# EasyEDA Pro project elisaday-high-color-value-low-cost-reflow-24a201e4.epro, schematic 控制板-无0402
Board Name: 220V控制板-无0402; Create Date: 2025-07-29; Page Name: 控制板; Project Name: 高颜值低成本回流焊红龙加热台; Schematic Name: 控制板-无0402; Update Date: 2025-08-03; Company: 嘉立创EDA; Page Size: A4; Version: V1.0
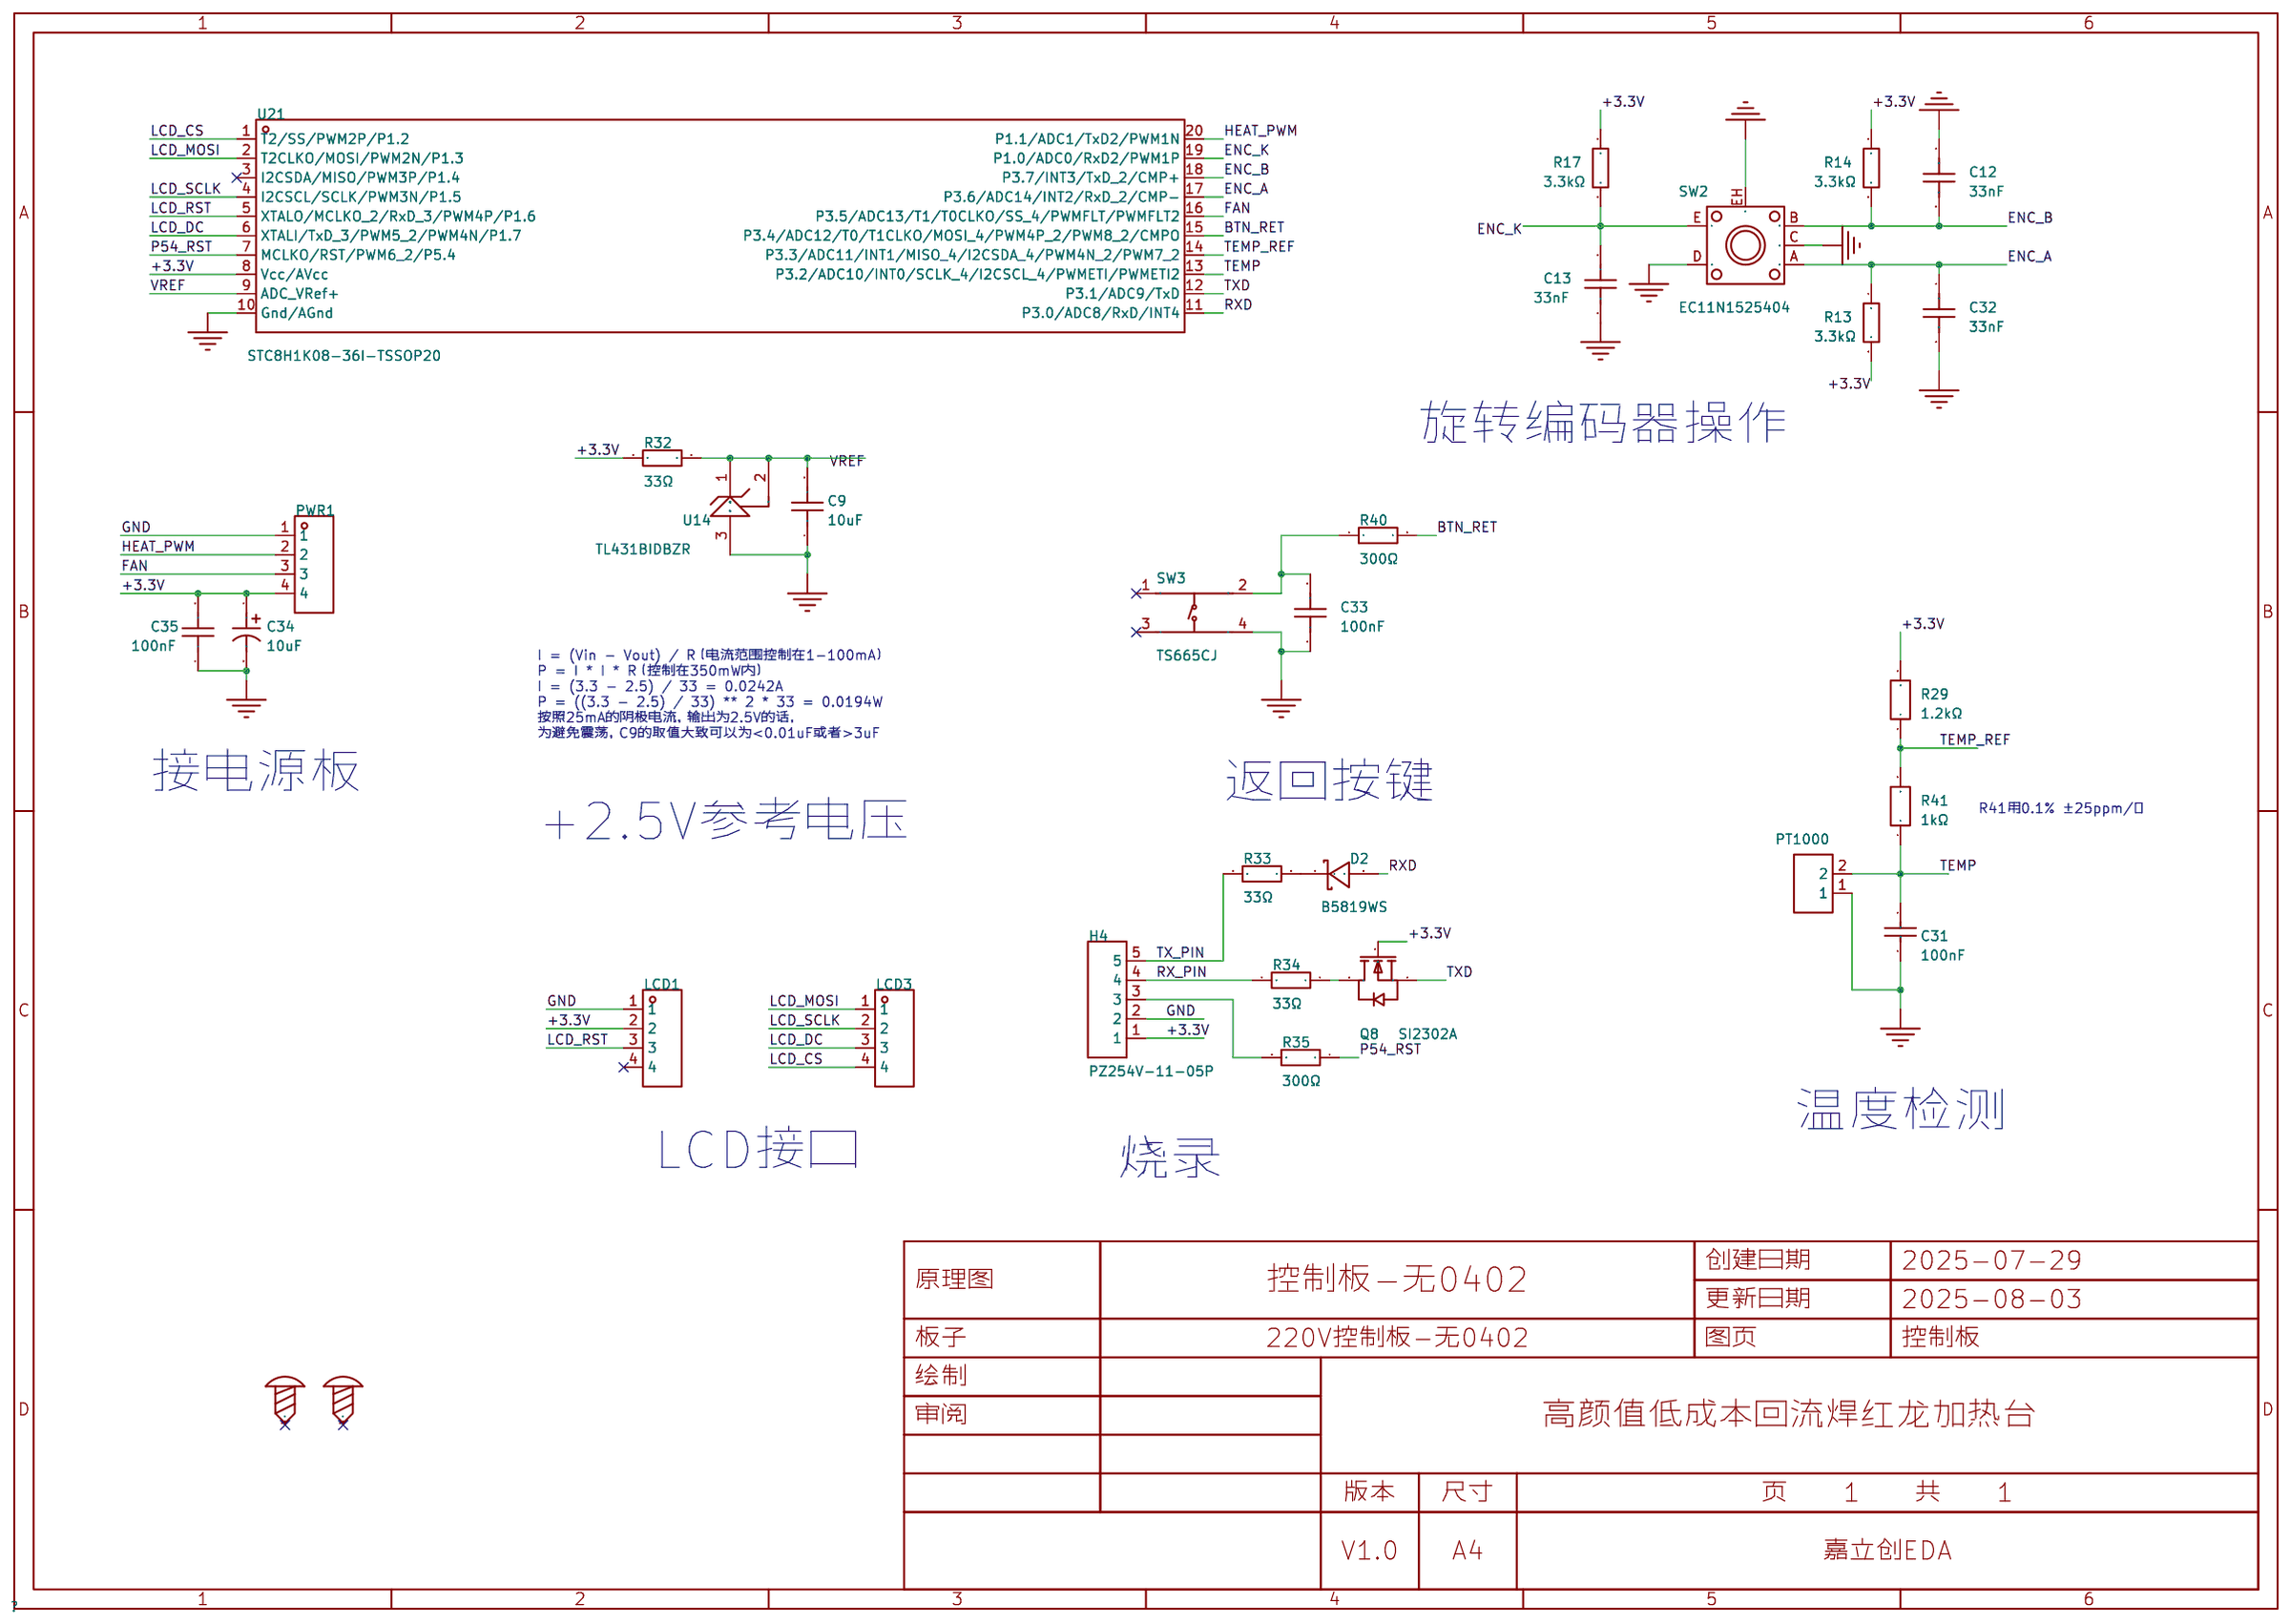
[diagram p1: schematic sheet]

## Parts
C9  10uF  [C0805]
C12  33nF  [C0603]
C13  33nF  [C0603]
C31  100nF  [C0805]
C32  33nF  [C0603]
C33  100nF  [C0805]
C34  10uF  [CAP-TH_BD5.0-P2.00-D0.8-FD]
C35  100nF  [C0805]
D2  B5819WS  [SOD-323_L1.8-W1.3-LS2.5-RD]
H4  PZ254V-11-05P  [HDR-TH_5P-P2.54-V-M]
LCD1  PZ254V-11-04P  [HDR-TH_4P-P2.54-V-M]
LCD3  PZ254V-11-04P  [HDR-TH_4P-P2.54-V-M]
PT1000  ZX-XH2.54-2PZZ  [CONN-TH_2P-P2.50_HX25003-2A]
PWR1  ZX-XH2.54-4PZZ  [CONN-TH_4P-P2.50_4PIN]
Q8  SI2302A  [SOT-23-3_L2.9-W1.3-P1.90-LS2.4-BR]
R13  3.3kΩ  [R0603]
R14  3.3kΩ  [R0603]
R17  3.3kΩ  [R0603]
R29  1.2kΩ  [R0805]
R32  33Ω  [R0805]
R33  33Ω  [R0805]
R34  33Ω  [R0805]
R35  300Ω  [R0805]
R40  300Ω  [R0805]
R41  1kΩ  [R0603]
SCREW1  -  [M3螺丝]
SCREW2  -  [M3螺丝]
SW2  EC11N1525404  [SW-TH_EC11NXXXX]
SW3  TS665CJ  [SW-TH_4P-L6.0-W6.0-P4.50-LS6.5]
U14  TL431BIDBZR  [SOT-23-3_L2.9-W1.3-P1.90-LS2.4-BR]
U21  STC8H1K08-36I-TSSOP20  [TSSOP-20_L6.5-W4.4-P0.65-LS6.4-BL]

## Library data of the parts
C9 = CL21A106KOQNNNE: 容值:10uF;精度:±10%;额定电压:16V;材质(温度系数):X5R;; LCSC Part Name: 10uF ±10% 16V; Supplier Part: C1713; Manufacturer: SAMSUNG(三星); Supplier Footprint: 0805; JLCPCB Part Class: Extended Part; Datasheet: https://atta.szlcsc.com/upload/public/pdf/source/20160218/1457707763339.pdf; Supplier: LCSC; Tolerance: ±10%; Voltage Rated: 16V; Temperature Coefficient: X5R
C12 C13 C32 = CC0603KRX7R9BB333: 容值:33nF;精度:±10%;额定电压:50V;材质(温度系数):X7R;; LCSC Part Name: 33nF ±10% 50V; Supplier Part: C106856; Manufacturer: YAGEO(国巨); Supplier Footprint: 0603; JLCPCB Part Class: Extended Part; Datasheet: https://atta.szlcsc.com/upload/public/pdf/source/20170919/C131031_1505787245477976978.pdf; Supplier: LCSC; Tolerance: ±10%; Voltage Rated: 50V; Temperature Coefficient: X7R
C31 C33 C35 = 0805B104K500NT: 容值:100nF;精度:±10%;额定电压:50V;温度系数:X7R;; LCSC Part Name: 100nF ±10% 50V; Supplier Part: C38141; Manufacturer: FH(风华); Supplier Footprint: 0805; JLCPCB Part Class: Extended Part; Datasheet: https://atta.szlcsc.com/upload/public/pdf/source/20200305/C486355_26A10D38EF8C2A5C37091D0039909270.pdf; Supplier: LCSC; Tolerance: ±10%; Voltage Rating: 50V; Temperature Coefficient: X7R
C34 = ERS1HM100D11OT: 容值:10uF;精度:±20%;额定电压:50V;; LCSC Part Name: 10uF ±20% 50V; Supplier Part: C106654; Manufacturer: AISHI(艾华集团); Supplier Footprint: 插件,D5xL11mm; JLCPCB Part Class: Extended Part; Datasheet: https://atta.szlcsc.com/upload/public/pdf/source/20191015/C438940_4B8E60A742BB0AE40DDEF87A5C89089D.pdf; Supplier: LCSC; Tolerance: ±20%; Voltage Rating: 50V; Pin Spacing: 2mm; Diameter: 5mm; Height - Seated (Max): 11mm; Lifetime: 5000hrs@105℃
D2 = B5819WS_C22624: 正向压降(Vf):600mV@1A;直流反向耐压(Vr):40V;平均整流电流(Io):1A;; LCSC Part Name: 电压:40V 电流:1A; Supplier Part: C22624; Manufacturer: CJ(江苏长电/长晶); Supplier Footprint: SOD-323; JLCPCB Part Class: 扩展库; Datasheet: https://atta.szlcsc.com/upload/public/pdf/source/20150407/1457707273359.pdf; Supplier: LCSC; Forward Voltage (Vf@If): 600mV@1A; Reverse Voltage (Vr): 40V; Average Rectified Current (Io): 1A
H4 = PZ254V-11-05P: 插针结构:1x5P;间距:2.54mm;行距:-;圆针/方针:方针;安装方式:直插;排数:单排;总PIN位数:5P;额定电流:-;额定电压:-;配合针长度:6mm;塑高:2.5mm;端接针长度:3mm;触头材质:黄铜;触头镀层:-;工作温度:-40℃~+105℃;颜色:黑色;; LCSC Part Name: 1x5P 间距:2.54mm 方针 直插; Supplier Part: C492404; Manufacturer: XFCN(兴飞); Supplier Footprint: 插件,P=2.54mm; JLCPCB Part Class: 扩展库; Datasheet: https://atta.szlcsc.com/upload/public/pdf/source/20200309/C492404_E51533260F8710EFF5D4617281164C1D.pdf; Supplier: LCSC; Pin Structure: 1x5P; Pitch: 2.54mm; Circluar Pins/Square Pins: 方针; Mounting Type: 直插; Number of Rows: 单排; Number of Pins: 5P; Length of Mating Pin: 6mm; Insulation Height: 2.5mm; Length of End Connection Pin: 3mm; Contact Material: 黄铜; Operating Temperature: -40℃~+105℃; Color: 黑色
LCD1 LCD3 = PZ254V-11-04P: 插针结构:1x4P;间距:2.54mm;行距:-;圆针/方针:方针;安装类型:直插;排数:单排;总PIN位数:4P;额定电流:3A;额定电压:250V;配合针长度:6mm;塑高:2.5mm;端接针长度:3mm;触头材质:-;工作温度范围:-40℃~+105℃;颜色:黑色;; LCSC Part Name: 间距:2.54mm 1x4P 直插 方针; Supplier Part: C2691448; Manufacturer: XFCN(兴飞); Supplier Footprint: 插件,P=2.54mm; JLCPCB Part Class: 扩展库; Datasheet: https://atta.szlcsc.com/upload/public/pdf/source/20200309/C492403_F9F19131791D08044AD4F84F8E751A34.pdf; Supplier: LCSC; Pin Structure: 1x4P; Pitch: 2.54mm; Circluar Pins/Square Pins: 方针; Mounting Type: 直插; Number of Rows: 单排; Number of Pins: 4P; Current Rating (Max): 3A; Voltage Rating (Max): 250V; Length of Mating Pin: 6mm; Insulation Height: 2.5mm; Length of End Connection Pin: 3mm; Operating Temperature Range: -40℃~+105℃; Color: 黑色
PT1000 = ZX-XH2.54-2PZZ: 插针结构:1x2P;间距:2.5mm;安装方式:直插;参考系列:XH;总PIN数:2P;排数:1;每排PIN数:2;行距:-;额定电流:3A;触头材质:黄铜;触头镀层:锡;工作温度范围:-25℃~+85℃;; LCSC Part Name: 1x2P 间距:2.5mm 直插 系列:XH; Supplier Part: C7429632; Manufacturer: Megastar(兆星); Supplier Footprint: 插件,P=2.5mm; JLCPCB Part Class: 扩展库; Datasheet: https://atta.szlcsc.com/upload/public/pdf/source/20230619/19BA6947230AA44A04D3EDD65E618FD0.pdf; Supplier: LCSC; Pins Structure: 1x2P; Pitch: 2.5mm; Mounting Type: 直插; Reference Series: XH; Number of Pins: 2P; Number of Rows: 1; Number of PINs Per Row: 2; Rated Current: 3A; Contact Material: 黄铜; Contact Plating: 锡; Operating Temperature: -25℃~+85℃; Rated Voltage (Max): 250V; Plastic Material: PA66; Flame Retardant Rating: UL94V-0; Color: 白色; Z-Height of the Board: 7mm; X-Length of Bottom Edge on Board (Spacing Line): 7.5mm; Y-Width of Bottom Edge on Board: 5.9mm
PWR1 = ZX-XH2.54-4PZZ: 插针结构:1x4P;间距:2.5mm;安装方式:直插;参考系列:XH;总PIN数:4P;排数:1;每排PIN数:4;行距:-;额定电流:3A;触头材质:黄铜;触头镀层:锡;工作温度范围:-25℃~+85℃;; LCSC Part Name: 1x4P 间距:2.5mm 直插 系列:XH; Supplier Part: C7429634; Manufacturer: Megastar(兆星); Supplier Footprint: 插件,P=2.5mm; JLCPCB Part Class: 扩展库; Datasheet: https://atta.szlcsc.com/upload/public/pdf/source/20230619/B529A2163E0159A644AB3383D208FB03.pdf; Supplier: LCSC; Pins Structure: 1x4P; Pitch: 2.5mm; Mounting Type: 直插; Reference Series: XH; Number of Pins: 4P; Number of Rows: 1; Number of PINs Per Row: 4; Rated Current: 3A; Contact Material: 黄铜; Contact Plating: 锡; Operating Temperature: -25℃~+85℃; Rated Voltage (Max): 250V; Plastic Material: PA66; Flame Retardant Rating: UL94V-0; Color: 白色; Z-Height of the Board: 7mm; X-Length of Bottom Edge on Board (Spacing Line): 12.5mm; Y-Width of Bottom Edge on Board: 5.9mm
Q8 = SI2302A: 类型:1个N沟道;漏源电压(Vdss):20V;连续漏极电流(Id):3.6A;导通电阻(RDS(on)@Vgs,Id):60mΩ@2.5V,3.1A;功率(Pd):800mW;阈值电压(Vgs(th)@Id):1.9V@250uA;; LCSC Part Name: 1个N沟道 耐压:20V 电流:3.6A; Supplier Part: C347483; Manufacturer: UMW(友台半导体); Supplier Footprint: SOT-23; JLCPCB Part Class: 扩展库; Datasheet: https://atta.szlcsc.com/upload/public/pdf/source/20231109/A05513FBA15B68C9BEB83ADF1A9CDC8E.pdf; Supplier: LCSC; Type: 1个N沟道; Drain Source Voltage (Vdss): 20V; Continuous Drain Current (Id): 3.6A; Drain Source On Resistance (RDS(on)@Vgs,Id): 60mΩ@2.5V,3.1A; Power Dissipation (Pd): 800mW; Gate Threshold Voltage (Vgs(th)@Id): 1.9V@250uA; Total Gate Charge (Qg@Vgs): 10nC@4.5V; Input Capacitance (Ciss@Vds): 300pF@10V; Reverse Transfer Capacitance (Crss@Vds): 80pF@10V; Operating Temperature: -55℃~+150℃
R13 R14 R17 = 0603WAF3301T5E: 电阻类型:厚膜电阻;阻值:3.3kΩ;精度:±1%;功率:100mW;最大工作电压:75V;温度系数:±100ppm/℃;; LCSC Part Name: 3.3kΩ ±1% 100mW 厚膜电阻; Supplier Part: C22978; Manufacturer: UNI-ROYAL(厚声); Supplier Footprint: 0603; JLCPCB Part Class: Basic Part; Datasheet: https://atta.szlcsc.com/upload/public/pdf/source/20200306/C422600_1E6D84923E4A46A82E41ADD87F860B5C.pdf; Supplier: LCSC; Type: 厚膜电阻; Tolerance: ±1%; Power(Watts): 100mW; Overload Voltage (Max): 75V; Temperature Coefficient: ±100ppm/℃; Operating Temperature Range: -55℃~+155℃
R29 = 0805W8F1201T5E: 电阻类型:厚膜电阻;阻值:1.2kΩ;精度:±1%;功率:125mW;最大工作电压:150V;温度系数:±100ppm/℃;; LCSC Part Name: 1.2kΩ ±1% 125mW 厚膜电阻; Supplier Part: C17379; Manufacturer: UNI-ROYAL(厚声); Supplier Footprint: 0805; JLCPCB Part Class: Basic Part; Datasheet: https://atta.szlcsc.com/upload/public/pdf/source/20200306/C422600_1E6D84923E4A46A82E41ADD87F860B5C.pdf; Supplier: LCSC; Type: 厚膜电阻; Tolerance: ±1%; Power(Watts): 125mW; Overload Voltage (Max): 150V; Temperature Coefficient: ±100ppm/℃; Operating Temperature Range: -55℃~+155℃
R32-R34 = 0805W8F330JT5E: 电阻类型:厚膜电阻;阻值:33Ω;精度:±1%;功率:125mW;最大工作电压:150V;温度系数:±200ppm/℃;; LCSC Part Name: 33Ω ±1% 125mW 厚膜电阻; Supplier Part: C17634; Manufacturer: UNI-ROYAL(厚声); Supplier Footprint: 0805; JLCPCB Part Class: Basic Part; Datasheet: https://atta.szlcsc.com/upload/public/pdf/source/20200306/C422600_1E6D84923E4A46A82E41ADD87F860B5C.pdf; Supplier: LCSC; Type: 厚膜电阻; Tolerance: ±1%; Power(Watts): 125mW; Overload Voltage (Max): 150V; Temperature Coefficient: ±200ppm/℃; Operating Temperature Range: -55℃~+155℃
R35 R40 = 0805W8F3000T5E: 电阻类型:厚膜电阻;阻值:300Ω;精度:±1%;功率:125mW;最大工作电压:150V;温度系数:±100ppm/℃;; LCSC Part Name: 300Ω ±1% 125mW 厚膜电阻; Supplier Part: C17617; Manufacturer: UNI-ROYAL(厚声); Supplier Footprint: 0805; JLCPCB Part Class: Basic Part; Datasheet: https://atta.szlcsc.com/upload/public/pdf/source/20200306/C422600_1E6D84923E4A46A82E41ADD87F860B5C.pdf; Supplier: LCSC; Type: 厚膜电阻; Tolerance: ±1%; Power(Watts): 125mW; Overload Voltage (Max): 150V; Temperature Coefficient: ±100ppm/℃; Operating Temperature Range: -55℃~+155℃
R41 = RT0603BRD071KL: 电阻类型:薄膜电阻;阻值:1kΩ;精度:±0.1%;功率:100mW;最大工作电压:75V;温度系数:±25ppm/℃;; LCSC Part Name: 薄膜电阻 1kΩ ±0.1% 100mW; Supplier Part: C110776; Manufacturer: YAGEO(国巨); Supplier Footprint: 0603; JLCPCB Part Class: Extended Part; Datasheet: https://atta.szlcsc.com/upload/public/pdf/source/20170704/1499151282044.pdf; Supplier: LCSC; Type: 薄膜电阻; Tolerance: ±0.1%; Power(Watts): 100mW; Overload Voltage (Max): 75V; Temperature Coefficient: ±25ppm/℃; Operating Temperature Range: -55℃~+155℃
SCREW1 SCREW2 = M3螺丝: Supplier Footprint: 插件; Check: false
SW2 = EC11N1525404: Supplier Part: C470748; Manufacturer: ALPSALPINE(阿尔卑斯阿尔派); Supplier Footprint: 插件; JLCPCB Part Class: 扩展库; Datasheet: https://atta.szlcsc.com/upload/public/pdf/source/20191216/C470795_DE763ECE59BD49533DB26DB53E5D34B2.pdf; Supplier: LCSC
SW3 = TS665CJ: 电路结构:单刀单掷;按钮形状:圆形按钮;安装方式:直插;开关长度:6mm;开关宽度:6mm;开关高度:5mm;触点电流:50mA;额定电压(DC):12V;带灯:-;机械寿命:-;; LCSC Part Name: 6*6*5mm 直插 轻触开关; Supplier Part: C393938; Manufacturer: SHOU HAN(首韩); Supplier Footprint: 插件; JLCPCB Part Class: 扩展库; Datasheet: https://atta.szlcsc.com/upload/public/pdf/source/20190521/C393938_BDABEAC600B4C55E200A80AA129B70BC.pdf; Supplier: LCSC; Circuit: 单刀单掷; Actuator Style: 圆形按钮; Mounting Style: 直插; Switch Length: 6mm; Switch Width: 6mm; Switch Height: 5mm; Contact Current: 50mA; Voltage Rating (DC): 12V
U14 = TL431BIDBZR: 输出类型:可调;输出电压:2.495V~36V;输出电流:100mA;精度:±0.5%;; Supplier Part: C41283; Manufacturer: TI(德州仪器); Supplier Footprint: SOT-23; JLCPCB Part Class: 扩展库; Datasheet: https://www.ti.com/cn/lit/gpn/tl431; Supplier: LCSC; Output Type: 可调; Output Voltage: 2.495V~36V; Output Current: 100mA; Tolerance: ±0.5%; Reference Type: 并联; Minimum Cathode Current for Regulation: 700uA; Operating Temperature: -40℃~+85℃@(TA)
U21 = STC8H1K08-36I-TSSOP20: CPU内核:51系列;应用领域:-;; LCSC Part Name: 宽电压/高速/高可靠/低功耗/强抗静电/较强抗干扰的新一代 8051 单片机; Supplier Part: C915673; Manufacturer: STC; Supplier Footprint: TSSOP-20; JLCPCB Part Class: 扩展库; Datasheet: https://atta.szlcsc.com/upload/public/pdf/source/20241226/4D2D43D1C972E3DE0CD105735CEEAD95.pdf; Supplier: LCSC; CPU Core: 51系列; Program Storage Size: 8KB; Program Memory Type: FLASH; Number of I/O: 17; ADC (Bit): 10bit; PWM (Bit): 16bit; Low Voltage Detection Threshold: 1.9V~5.5V

## Nets
+3.3V: C34.1 C35.2 H4.1 LCD1.2 PWR1.4 Q8.1(G) R13.2 R14.1 R17.1 R29.2 R32.2 U21.8(Vcc/AVcc)
GND: C9.1 C12.1 C13.2 C31.1 C32.2 C33.1 C34.2 C35.1 H4.2 LCD1.1 PT1000.1 PWR1.1 SW2.C SW2.D SW2.EH SW3.4(D) U14.3(ANODE) U21.10(Gnd/AGnd)
BTN_RET: R40.2 U21.15(P3.4/ADC12/T0/T1CLKO/MOSI_4/PWM4P_2/PWM8_2/CMPO)
ENC_A: C32.1 R13.1 SW2.A U21.17(P3.6/ADC14/INT2/RxD_2/CMP-)
ENC_B: C12.2 R14.2 SW2.B U21.18(P3.7/INT3/TxD_2/CMP+)
ENC_K: C13.1 R17.2 SW2.E U21.19(P1.0/ADC0/RxD2/PWM1P)
FAN: PWR1.3 U21.16(P3.5/ADC13/T1/T0CLKO/SS_4/PWMFLT/PWMFLT2)
HEAT_PWM: PWR1.2 U21.20(P1.1/ADC1/TxD2/PWM1N)
LCD_CS: LCD3.4 U21.1(T2/SS/PWM2P/P1.2)
LCD_DC: LCD3.3 U21.6(XTALI/TxD_3/PWM5_2/PWM4N/P1.7)
LCD_MOSI: LCD3.1 U21.2(T2CLKO/MOSI/PWM2N/P1.3)
LCD_RST: LCD1.3 U21.5(XTALO/MCLKO_2/RxD_3/PWM4P/P1.6)
LCD_SCLK: LCD3.2 U21.4(I2CSCL/SCLK/PWM3N/P1.5)
P54_RST: R35.1 U21.7(MCLKO/RST/PWM6_2/P5.4)
RX_PIN: H4.4 R34.2
RXD: D2.2(A) U21.11(P3.0/ADC8/RxD/INT4)
TEMP: C31.2 PT1000.2 R41.1 U21.13(P3.2/ADC10/INT0/SCLK_4/I2CSCL_4/PWMETI/PWMETI2)
TEMP_REF: R29.1 R41.2 U21.14(P3.3/ADC11/INT1/MISO_4/I2CSDA_4/PWM4N_2/PWM7_2)
TX_PIN: H4.5 R33.2
TXD: Q8.2(S) U21.12(P3.1/ADC9/TxD)
VREF: C9.2 R32.1 U14.1(CATHODE) U14.2(REF) U21.9(ADC_VRef+)
$1N1367: Q8.3(D) R34.1
$1N1379: H4.3 R35.2
$1N1427: C33.2 R40.1 SW3.2(B)
$1N12340: D2.1(K) R33.1

Not connected (* = marked no-connect by the designer): LCD1 4*; SCREW1 1*; SCREW2 1*; SW3 1(A)* 3(C)*; U21 3(I2CSDA/MISO/PWM3P/P1.4)*

## Notes on the sheet
- 旋转编码器操作
- I = (Vin - Vout) / R（电流范围控制在1-100mA）
  P = I * I * R（控制在350mW内）
  I = (3.3 - 2.5) / 33 = 0.0242A
  P = ((3.3 - 2.5) / 33) ** 2 * 33 = 0.0194W
  按照25mA的阴极电流，输出为2.5V的话，
  为避免震荡，C9的取值大致可以为<0.01uF或者>3uF
- 接电源板
- 返回按键
- R41用0.1% ±25ppm/℃
- +2.5V参考电压
- 温度检测
- LCD接口
- 烧录
